# Altium project EMBL51537_SC_SP2_V2.1_20210906.PrjPcb
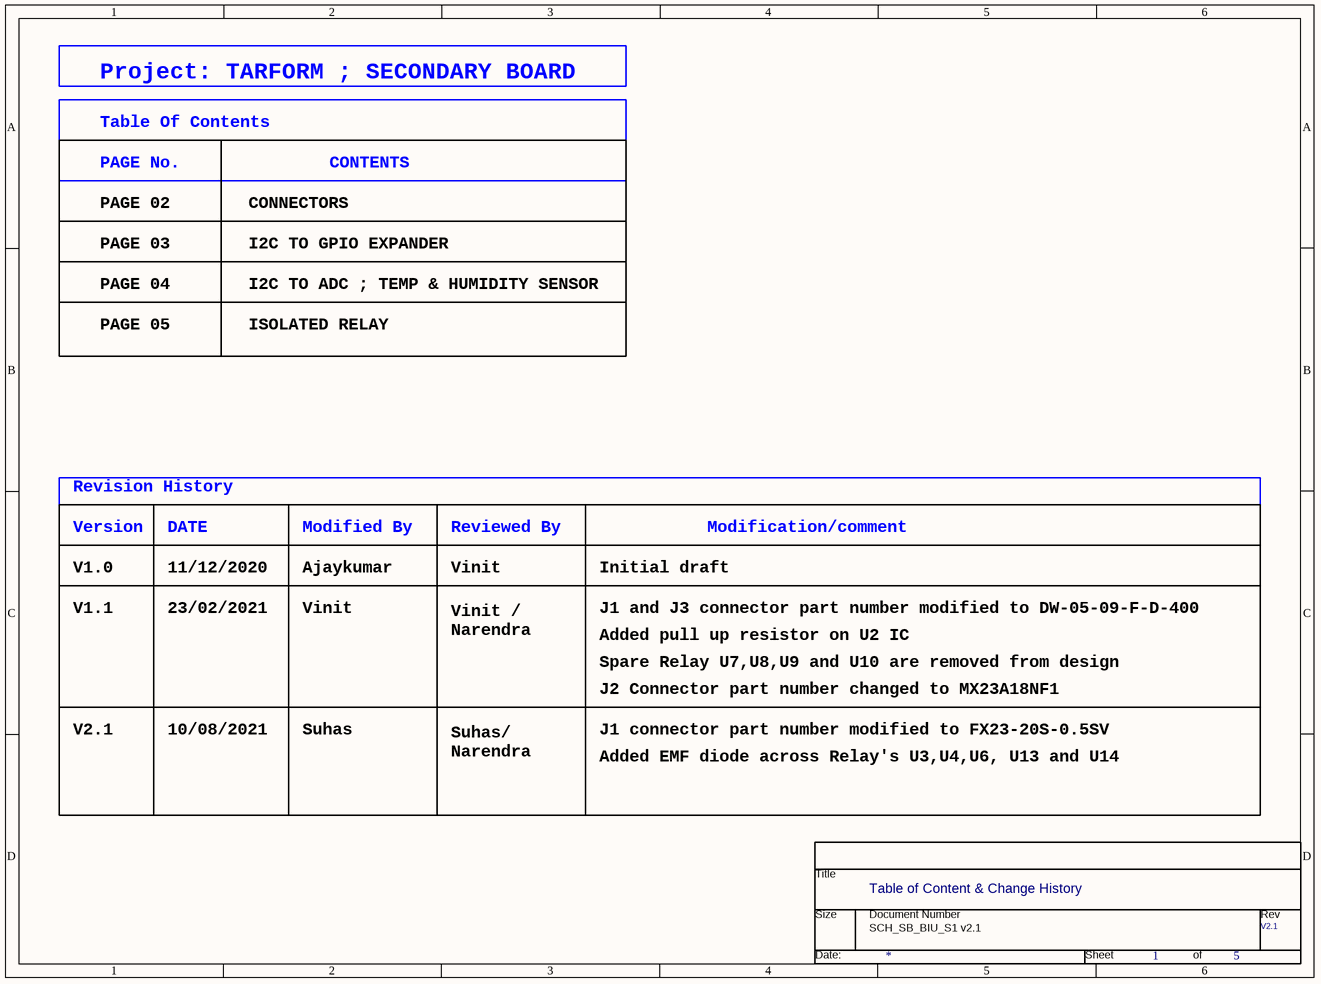
[diagram p0: PAGE01_CONTENT.SchDoc]
5 sheets, 128 parts. Net scope: global (net labels, ports and power ports of the same name join across sheets).
Sheets:
  PAGE01_CONTENT.SchDoc
  PAGE02_CONNECTOR.SchDoc
  PAGE03_I2C-GPIO.SchDoc
  PAGE04_TEMP & HUMIDITY.SchDoc
  PAGE05_ISO_RELAYS.SchDoc

## Sheet PAGE01_CONTENT.SchDoc
size 246 x 182 mm

### Parts
(Parts that share a designator on the sheet are numbered #1, #2 ... from top to bottom, then left to right.)
*#1  Page Count: 5  Page Number: 1  Title: Table of Content & Change History  RevCode: V2.1  (hidden comment: TitleBlock0)  (graphical)

### Notes on the sheet
- Project: TARFORM ; SECONDARY BOARD
- Table Of Contents
- PAGE No.
- CONTENTS
- PAGE 03
- PAGE 02
- I2C TO GPIO EXPANDER
- CONNECTORS
- PAGE 05
- PAGE 04
- I2C TO ADC ; TEMP & HUMIDITY SENSOR
- ISOLATED RELAY
- Version
- Revision History
- DATE
- Modified By
- Reviewed By
- Modification/comment
- V1.0
- 11/12/2020
- Ajaykumar
- Vinit
- Vinit /
  Narendra
- Initial draft
- V1.1
- 23/02/2021
- J1 and J3 connector part number modified to DW-05-09-F-D-400
- Added pull up resistor on U2 IC
- Spare Relay U7,U8,U9 and U10 are removed from design
- V2.1
- 10/08/2021
- Suhas
- Suhas/
  Narendra
- J2 Connector part number changed to MX23A18NF1
- J1 connector part number modified to FX23-20S-0.5SV
- Added EMF diode across Relay's U3,U4,U6, U13 and U14
- SCH_SB_BIU_S1 v2.1
- (in symbol TitleBlock0) Title; Size; Document Number; Rev; Date:; Sheet; of

### Library data of the parts
*#1 = TitleBlock0: Page Size: A; Page Create Date: March  8, 1995; Page Modify Date: *

## Sheet PAGE02_CONNECTOR.SchDoc
size 386 x 246 mm
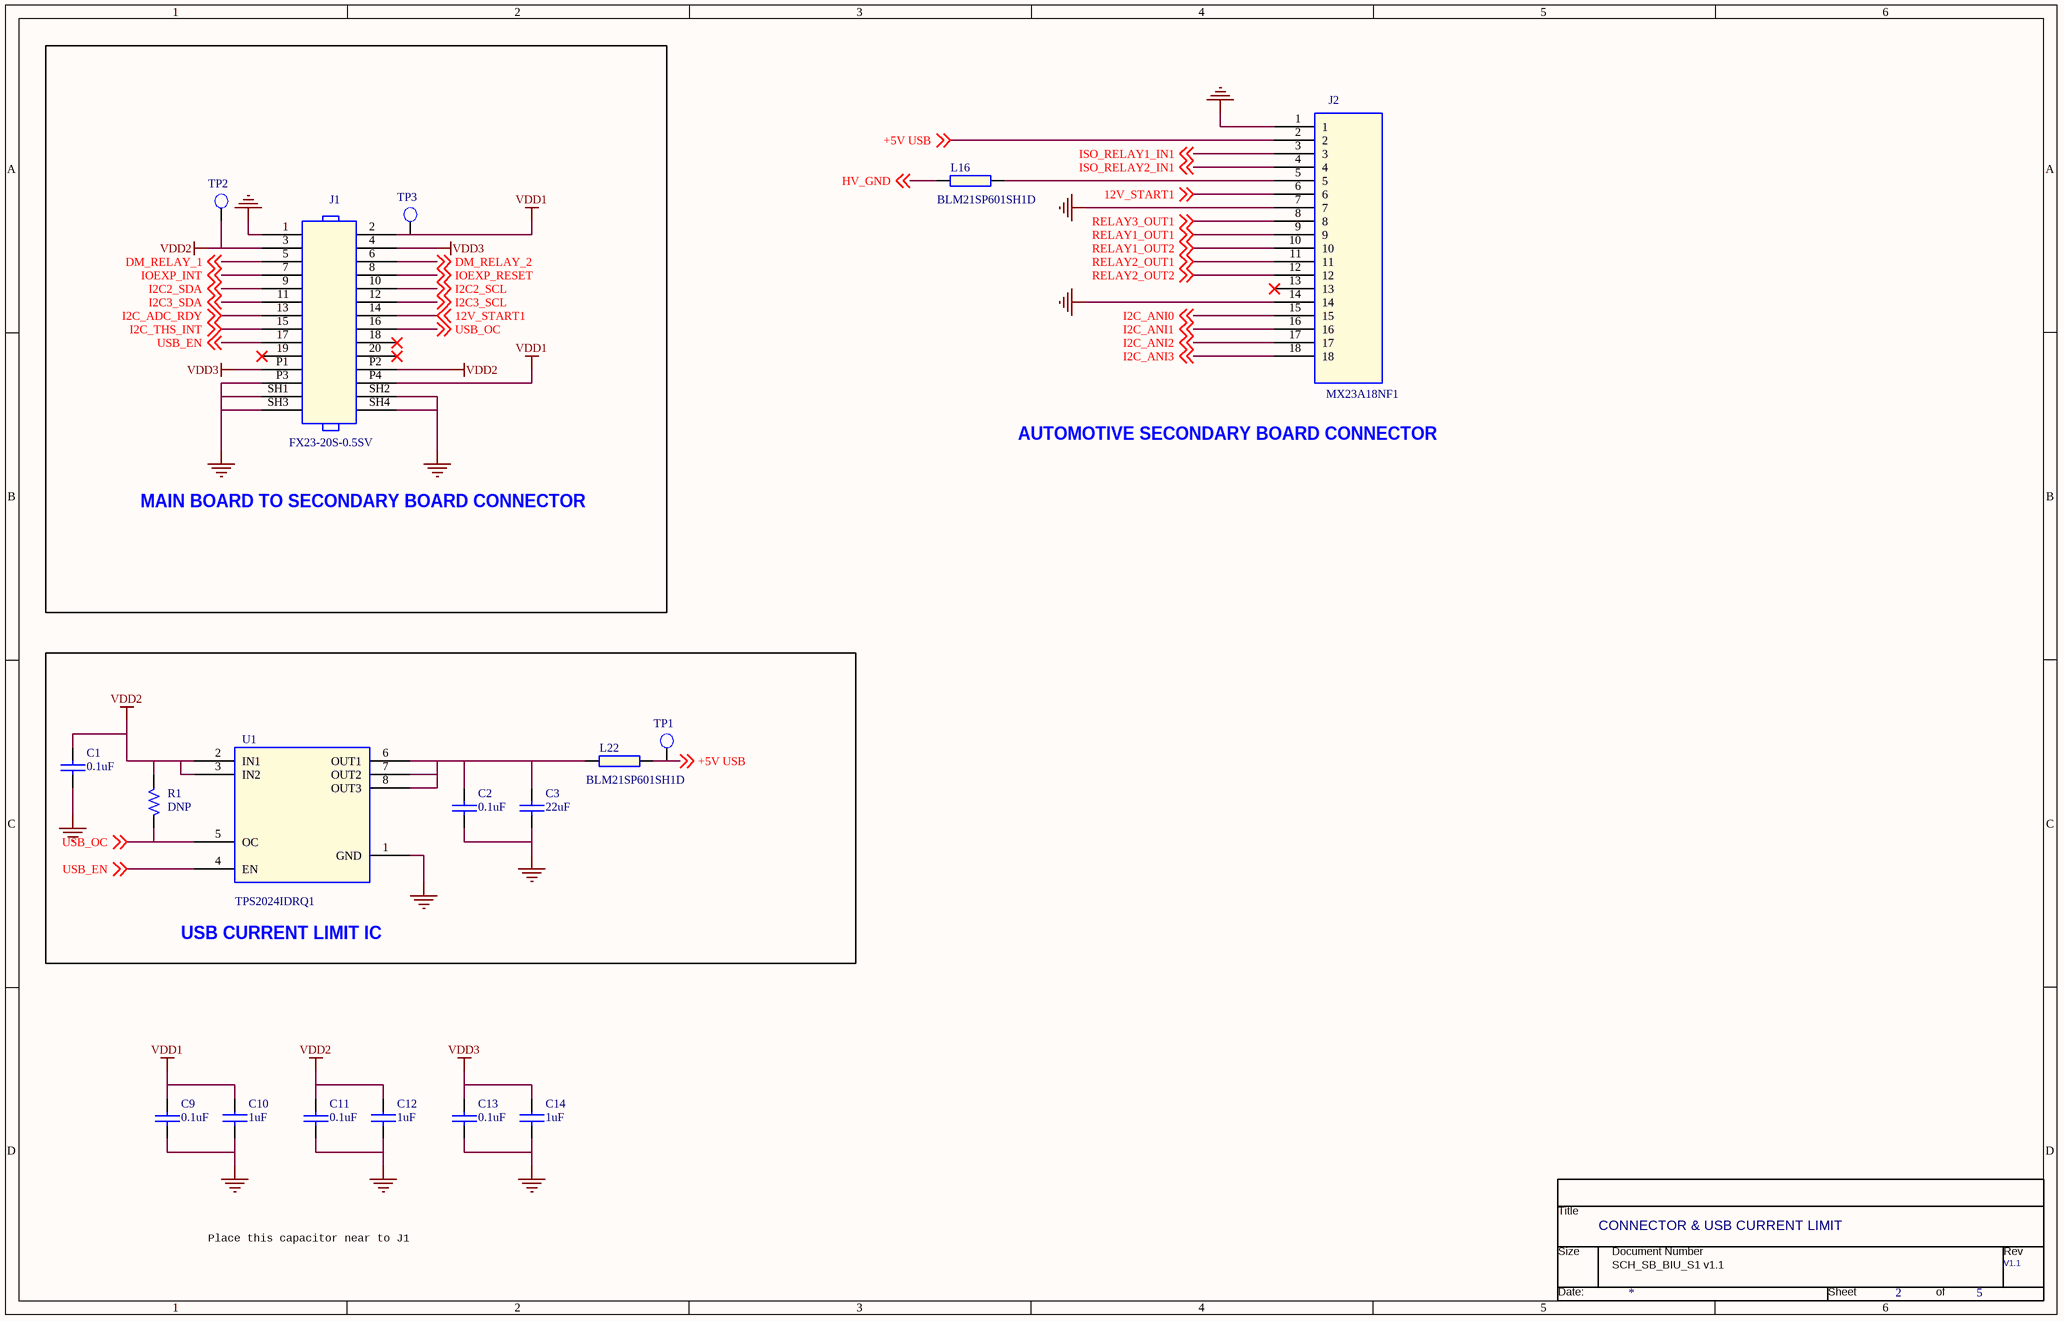
[diagram p1: PAGE02_CONNECTOR.SchDoc]

### Parts
(Parts that share a designator on the sheet are numbered #1, #2 ... from top to bottom, then left to right.)
*#2  Page Count: 5  Page Number: 2  Title: CONNECTOR & USB CURRENT LIMIT  RevCode: V1.1  (hidden comment: TitleBlock0)  (graphical)
C1  0.1uF  [CAPC1005X55N_A]
C2  0.1uF  [CAPC1005X55N_A]
C3  22uF  [CAPC1608X80N_A]
C9  0.1uF  [CAPC1005X55N_A]
C10  1uF  [CAPC1608X90N_A]
C11  0.1uF  [CAPC1005X55N_A]
C12  1uF  [CAPC1608X90N_A]
C13  0.1uF  [CAPC1005X55N_A]
C14  1uF  [CAPC1608X90N_A]
J1  FX23-20S-0.5SV  [HIROSE_FX23-20S-0P5SV]
J2  MX23A18NF1  [JAE_MX23A18NF1]
L16  BLM21SP601SH1D  [INDC1608X95N]
L22  BLM21SP601SH1D  [INDC1608X95N]
R1  DNP  [AX/RC05]
TP1  T POINT R  [TPC160H100]  (value not drawn)
TP2  T POINT R  [TPC160H100]  (value not drawn)
TP3  T POINT R  [TPC160H100]  (value not drawn)
U1  TPS2024IDRQ1  [SOIC127P600X175-8N_TI]

### Blocks framed on the sheet
MAIN BOARD TO SECONDARY BOARD CONNECTOR: J1 TP2 TP3
USB CURRENT LIMIT IC: C1-C3 L22 R1 TP1 U1

### Nets
GND: C1.2 C2.2 C3.2 C9.2 C10.2 C11.2 C12.2 C13.2 C14.2 J1.1 J1.P3 J1.SH1 J1.SH2 J1.SH3 J1.SH4 J2.1 J2.7 J2.14 U1.1(GND)
VDD1: C9.1 C10.1 J1.2 J1.P4 TP3.1(TP)
VDD2: C1.1 C11.1 C12.1 J1.3 J1.P2 R1.1 TP2.1(TP) U1.2(IN1) U1.3(IN2)
VDD3: C13.1 C14.1 J1.4 J1.P1
12V_START1: J1.14 J2.6 ; off-sheet 12V_START1
+5V USB: J2.2 L22.2 TP1.1(TP) ; off-sheet +5V USB
DM_RELAY_1: J1.5 ; off-sheet DM_RELAY_1
DM_RELAY_2: J1.6 ; off-sheet DM_RELAY_2
HV_GND: L16.1 ; off-sheet HV_GND
I2C2_SCL: J1.10 ; off-sheet I2C2_SCL
I2C2_SDA: J1.9 ; off-sheet I2C2_SDA
I2C3_SCL: J1.12 ; off-sheet I2C3_SCL
I2C3_SDA: J1.11 ; off-sheet I2C3_SDA
I2C_ADC_RDY: J1.13 ; off-sheet I2C_ADC_RDY
I2C_ANI0: J2.15 ; off-sheet I2C_ANI0
I2C_ANI1: J2.16 ; off-sheet I2C_ANI1
I2C_ANI2: J2.17 ; off-sheet I2C_ANI2
I2C_ANI3: J2.18 ; off-sheet I2C_ANI3
I2C_THS_INT: J1.15 ; off-sheet I2C_THS_INT
IOEXP_INT: J1.7 ; off-sheet IOEXP_INT
IOEXP_RESET: J1.8 ; off-sheet IOEXP_RESET
ISO_RELAY1_IN1: J2.3 ; off-sheet ISO_RELAY1_IN1
ISO_RELAY2_IN1: J2.4 ; off-sheet ISO_RELAY2_IN1
RELAY1_OUT1: J2.9 ; off-sheet RELAY1_OUT1
RELAY1_OUT2: J2.10 ; off-sheet RELAY1_OUT2
RELAY2_OUT1: J2.11 ; off-sheet RELAY2_OUT1
RELAY2_OUT2: J2.12 ; off-sheet RELAY2_OUT2
RELAY3_OUT1: J2.8 ; off-sheet RELAY3_OUT1
USB_EN: J1.17 U1.4(EN) ; off-sheet USB_EN
USB_OC: J1.16 R1.2 U1.5(OC) ; off-sheet USB_OC
NetC2_1: C2.1 C3.1 L22.1 U1.6(OUT1) U1.7(OUT2) U1.8(OUT3)
NetJ2_5: J2.5 L16.2

Not connected (* = marked no-connect by the designer): J1 18(9)* 19(22)* 20(10)*; J2 13*

### Notes on the sheet
- AUTOMOTIVE SECONDARY BOARD CONNECTOR
- Place this capacitor near to J1
- SCH_SB_BIU_S1 v1.1
- (in symbol TitleBlock0) Title; Size; Document Number; Rev; Date:; Sheet; of

### Library data of the parts
*#2 = TitleBlock0: Page Size: A; Page Create Date: March  8, 1995; Page Modify Date: *
C1 C2 C9 C11 C13 = CAP_NP_78: CAP CER 0.1uF 16V 10% X7R 0402; Manufacturer: MURATA; Manufacturere's P/N: GRM155R71C104KA88J; CLASS: DISCRETE; SIGNAL_MODEL: DEFAULT_CAPACITOR_100000pF_2_1; AGILE_PN: 150-75182; CAD_APPROVED: Yes; FPLIST: CC0402_25,CC0402_HD,0402_CC; WVDC: 16V; Tolerance: 10%; ROHS: Yes; HEIGHT: 0.635MM; TOL: 10%; PCB Footprint: CAPC1005X55N_A
  C1 C2: package: 0402
  C9 C11 C13: Package: 0402
C3 = CAP_NP_78: MLCC - SMD/SMT 22uF+/-20% 16V X5R; Manufacturer: SAMSUNG ELECTRO; Manufacturere's P/N: CL10A226MO7JZNC; CLASS: DISCRETE; SIGNAL_MODEL: DEFAULT_CAPACITOR_100000pF_2_1; AGILE_PN: 150-75182; CAD_APPROVED: Yes; FPLIST: CC0402_25,CC0402_HD,0402_CC; package: 0603; WVDC: 16V; ROHS: Yes; PCB Footprint: CAPC1608X80N_A
C10 C12 C14 = CAP NP: CAP CER 1uF 25V 10% X7R 0603; Manufacturer: TDK; Manufacturere's P/N: CGA3E1X7R1E105K080AC; Package: 0603; PCB Footprint: CAPC1608X90N_A
J1 = CONN PCB 12x2-P_1: Manufacturere's P/N: FX23-20S-0.5SV; Manufacturer Part Number: FX23-20S-0.5SV; PCB Footprint: HIROSE_FX23-20S-0P5SV
J2 = MX23A18NF1_0: CONN HEADER R/A 18POS 2.5MM; Manufacturer: JAE Electronics; PCB Footprint: JAE_MX23A18NF1; Manufacturer Part Number: MX23A18NF1; Manufacturere's P/N: MX23A18NF1
L16 L22 = L-33R100MHz-3A-25%-0603: FERRITEBEAD SMD Z100MHZ=600OHM 2; Manufacturer: Murata Electronics; Tolerance: 25%; Rating: 3A; PCB Footprint: INDC2012X105N; User_Value: BLM21SP601SH1D; Manufacturere's P/N: BLM21SP601SH1D; Manufacturer Part Number: BLM21SP601SH1D; Package: 0805
R1 = R_0: RES SMD 10K OHM 1% 1/10W 0603; Manufacturer Part Number: RCA060310K0FKEA; Manufacturer: Vishay Dale; TC2: 0; POWER: RMAX; MAX_TEMP: RTMAX; SLOPE: RSMAX; VOLTAGE: RVMAX; PSpiceTemplate: R^@REFDES %1 %2 ?TOLERANCE|R^@REFDES| @VALUE TC=@TC1,@TC2 ?TOLERANCE|\n.model R^@REFDES RES R=1 DEV=@TOLERANCE%|; DIST: FLAT; PCB Footprint: RESC1608X55N_B; TC1: 0; TOLERANCE: 1%; Manufacturere's P/N: RCA060310K0FKEA; Package: 0603; Value: DNP
U1 = TPS2024IDRQ1_0: Power Switch ICs - Power Distribution Auto Cat Pwr-Dist Sw; Manufacturer: TI; Package: SOIC-8; Manufacturere's P/N: TPS2024IDRQ1; PCB Footprint: SOIC127P600X175-8N_TI
TP1-TP3 = T POINT R: PCB Footprint: TPC160H100

## Sheet PAGE03_I2C-GPIO.SchDoc
size 386 x 246 mm
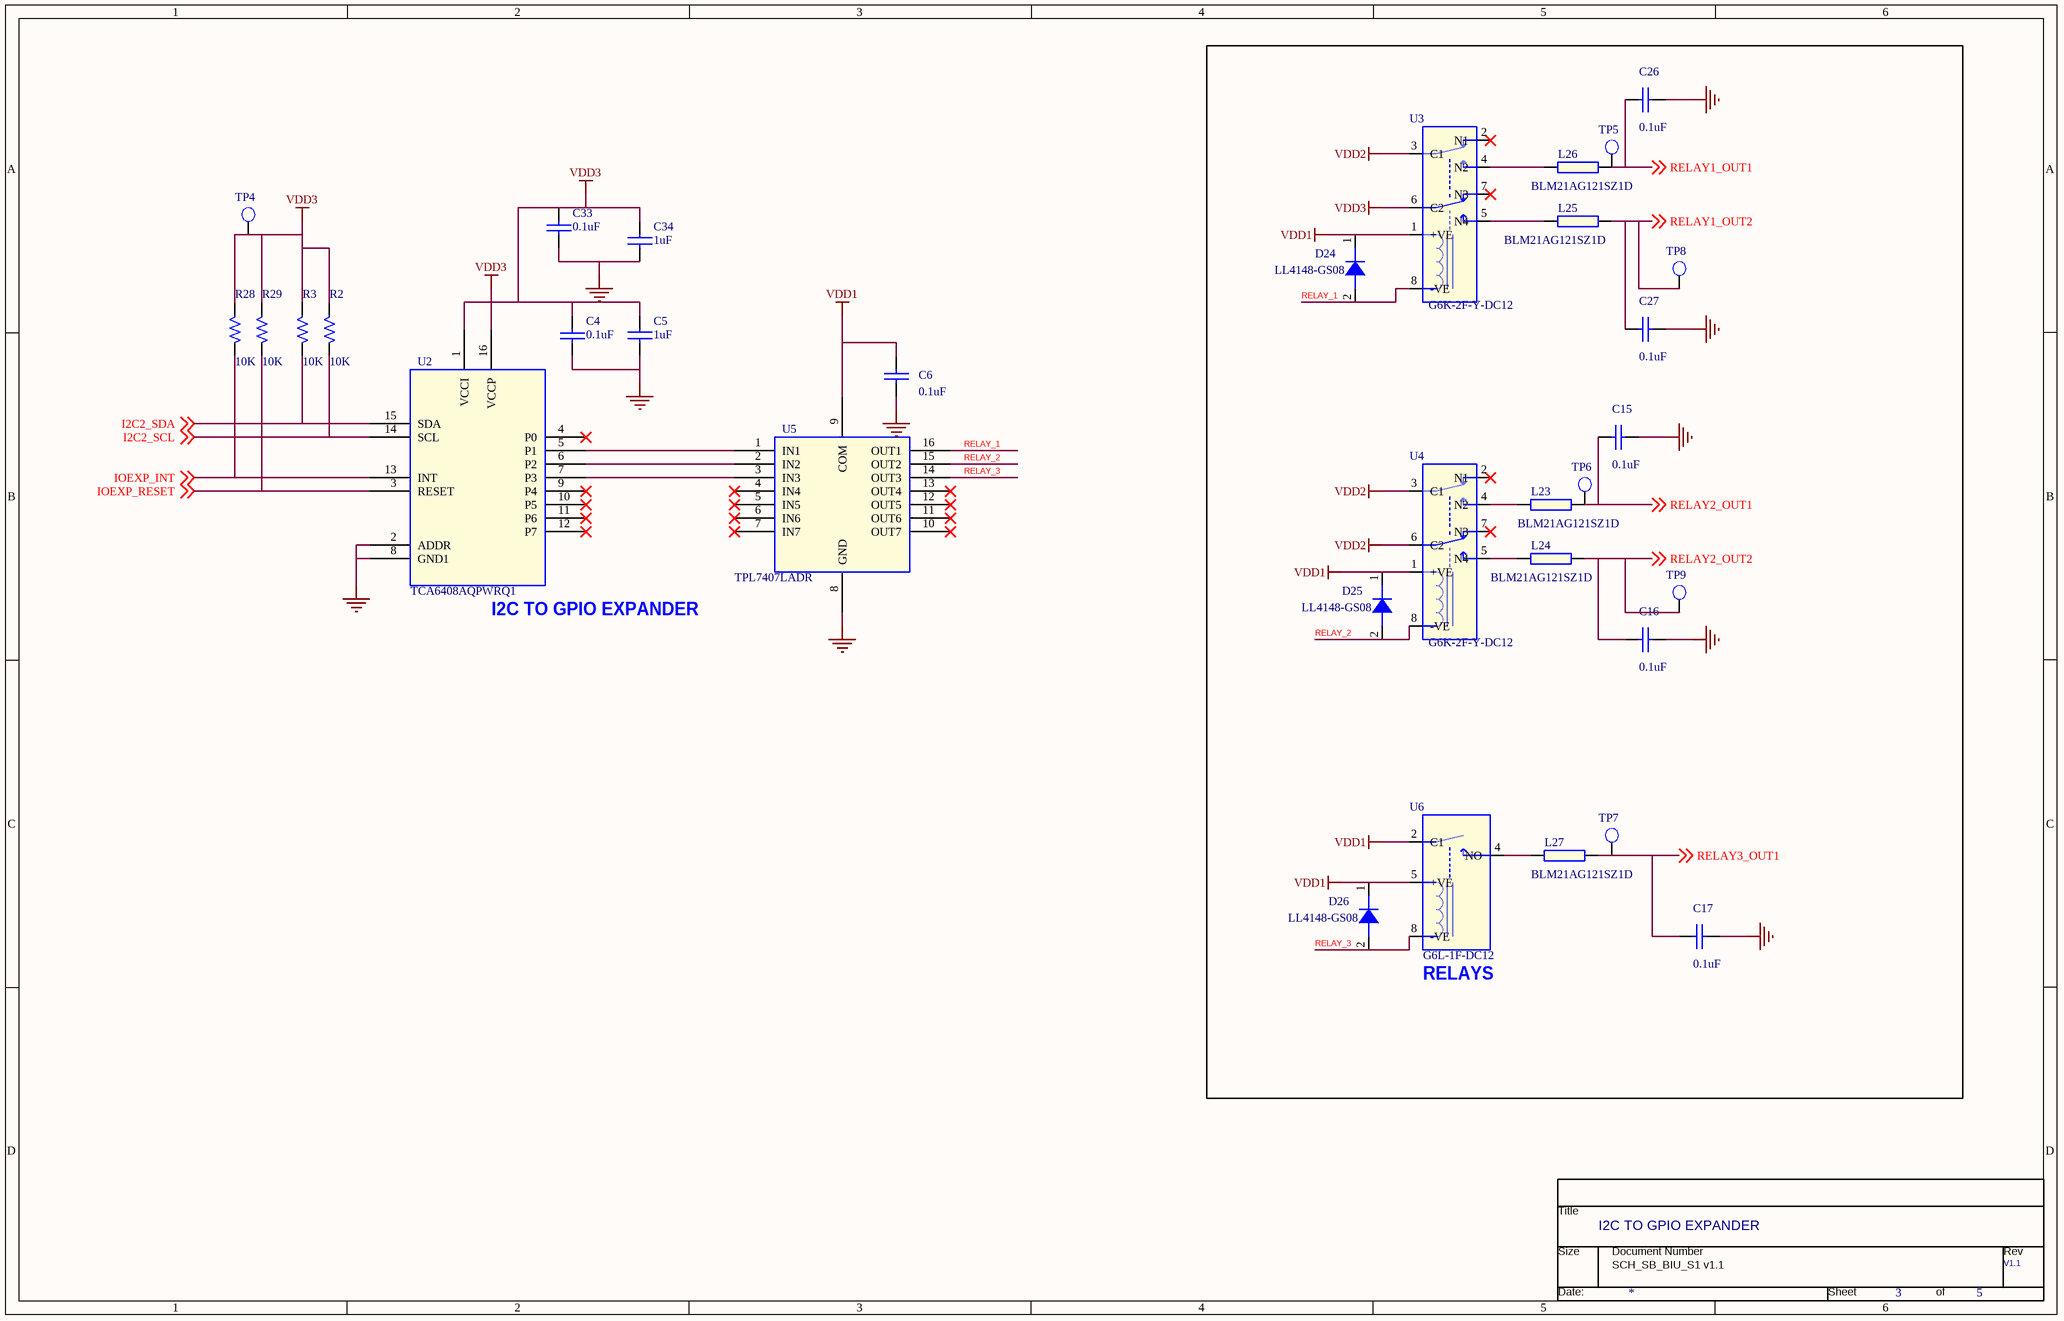
[diagram p2: PAGE03_I2C-GPIO.SchDoc]

### Parts
(Parts that share a designator on the sheet are numbered #1, #2 ... from top to bottom, then left to right.)
*#3  Page Count: 5  Page Number: 3  Title: I2C TO GPIO EXPANDER  RevCode: V1.1  (hidden comment: TitleBlock0)  (graphical)
C4  0.1uF  [CAPC1005X55N_A]
C5  1uF  [CAPC1608X90N_A]
C6  0.1uF  [CAPC1608X90N]
C15  0.1uF  [CAPC1608X90N]
C16  0.1uF  [CAPC1608X90N]
C17  0.1uF  [CAPC1608X90N]
C26  0.1uF  [CAPC1608X90N]
C27  0.1uF  [CAPC1608X90N]
C33  0.1uF  [CAPC1005X55N_A]
C34  1uF  [CAPC1608X90N_A]
D24  LL4148-GS08  [DIOMELF3515N]
D25  LL4148-GS08  [DIOMELF3515N]
D26  LL4148-GS08  [DIOMELF3515N]
L23  BLM21AG121SZ1D  [INDC1608X95N]
L24  BLM21AG121SZ1D  [INDC1608X95N]
L25  BLM21AG121SZ1D  [INDC1608X95N]
L26  BLM21AG121SZ1D  [INDC1608X95N]
L27  BLM21AG121SZ1D  [INDC1608X95N]
R2  10K  [AX/RC05]
R3  10K  [AX/RC05]
R28  10K  [AX/RC05]
R29  10K  [AX/RC05]
TP4  T POINT R  [TPC160H100]  (value not drawn)
TP5  T POINT R  [TPC160H100]  (value not drawn)
TP6  T POINT R  [TPC160H100]  (value not drawn)
TP7  T POINT R  [TPC160H100]  (value not drawn)
TP8  T POINT R  [TPC160H100]  (value not drawn)
TP9  T POINT R  [TPC160H100]  (value not drawn)
U2  TCA6408AQPWRQ1  [TSSOP65P640X120-16N_B]
U3  G6K-2F-Y-DC12  [RELAY_G6K-2F-Y-DC12]
U4  G6K-2F-Y-DC12  [RELAY_G6K-2F-Y-DC12]
U5  TPL7407LADR  [SOIC127P600X175-16N_TI]
U6  G6L-1F-DC12  [RELAY_G6L-1F-DC12]

### Blocks framed on the sheet
RELAYS: C15-C17 C26 C27 D24-D26 L23-L27 TP5-TP9 U3 U4 U6

### Nets
GND: C4.2 C5.2 C6.1 C15.1 C16.1 C17.1 C26.1 C27.1 C33.2 C34.2 U2.2(ADDR) U2.8(GND1) U5.8(GND)
VDD1: C6.2 D24.1(K) D25.1(K) D26.1(K) U3.1(+VE) U4.1(+VE) U5.9(COM) U6.2(C1) U6.5(+VE)
VDD2: U3.3(C1) U4.3(C1) U4.6(C2)
VDD3: C4.1 C5.1 C33.1 C34.1 R2.1 R3.1 R28.1 R29.1 TP4.1(TP) U2.1(VCCI) U2.16(VCCP) U3.6(C2)
I2C2_SCL: R2.2 U2.14(SCL) ; off-sheet I2C2_SCL
I2C2_SDA: R3.2 U2.15(SDA) ; off-sheet I2C2_SDA
IOEXP_INT: R28.2 U2.13(INT) ; off-sheet IOEXP_INT
IOEXP_RESET: R29.2 U2.3(RESET) ; off-sheet IOEXP_RESET
RELAY1_OUT1: C26.2 L26.2 TP5.1(TP) ; off-sheet RELAY1_OUT1
RELAY1_OUT2: C27.2 L25.2 TP8.1(TP) ; off-sheet RELAY1_OUT2
RELAY2_OUT1: C15.2 L23.2 TP6.1(TP) ; off-sheet RELAY2_OUT1
RELAY2_OUT2: C16.2 L24.2 TP9.1(TP) ; off-sheet RELAY2_OUT2
RELAY3_OUT1: C17.2 L27.2 TP7.1(TP) ; off-sheet RELAY3_OUT1
RELAY_1: D24.2(A) U3.8(-VE) U5.16(OUT1)
RELAY_2: D25.2(A) U4.8(-VE) U5.15(OUT2)
RELAY_3: D26.2(A) U5.14(OUT3) U6.8(-VE)
NetL23_1: L23.1 U4.4(N2)
NetL24_1: L24.1 U4.5(N4)
NetL25_1: L25.1 U3.5(N4)
NetL26_1: L26.1 U3.4(N2)
NetL27_1: L27.1 U6.4(NO)
NetU2_5: U2.5(P1) U5.1(IN1)
NetU2_6: U2.6(P2) U5.2(IN2)
NetU2_7: U2.7(P3) U5.3(IN3)

Not connected (* = marked no-connect by the designer): U2 4(P0)* 9(P4)* 10(P5)* 11(P6)* 12(P7)*; U3 2(N1)* 7(N3)*; U4 2(N1)* 7(N3)*; U5 4(IN4)* 5(IN5)* 6(IN6)* 7(IN7)* 10(OUT7)* 11(OUT6)* 12(OUT5)* 13(OUT4)*

### Notes on the sheet
- (near U2) I2C TO GPIO EXPANDER
- SCH_SB_BIU_S1 v1.1
- (in symbol TitleBlock0) Title; Size; Document Number; Rev; Date:; Sheet; of

### Library data of the parts
*#3 = TitleBlock0: Page Size: A; Page Create Date: March  8, 1995; Page Modify Date: *
C4 C33 = CAP_NP_78: CAP CER 0.1uF 16V 10% X7R 0402; Manufacturere's P/N: GRM155R71C104KA88J; Manufacturer: MURATA; CLASS: DISCRETE; FPLIST: CC0402_25,CC0402_HD,0402_CC; CAD_APPROVED: Yes; AGILE_PN: 150-75182; SIGNAL_MODEL: DEFAULT_CAPACITOR_100000pF_2_1; PCB Footprint: CAPC1005X55N_A; TOL: 10%; HEIGHT: 0.635MM; ROHS: Yes; Tolerance: 10%; WVDC: 16V; Package: 0402
C5 C34 = CAP NP: CAP CER 1uF 25V 10% X7R 0603; Manufacturere's P/N: CGA3E1X7R1E105K080AC; Manufacturer: TDK; PCB Footprint: CAPC1608X90N_A; Package: 0603
C6 C15-C17 = CAP_NP_78: CAP CER 0.1UF 50V X7R 0603; Manufacturere's P/N: GRM188R71H104KA93D; Manufacturer: MURATA; CLASS: DISCRETE; CAD_APPROVED: Yes; Tolerance: ±10%; AGILE_PN: 150-75182; SIGNAL_MODEL: DEFAULT_CAPACITOR_100000pF_2_1; PCB Footprint: CAPC1608X90N; WVDC: 50V; HEIGHT: 0.635MM; ROHS: Yes; Package: 0603
C26 C27 = CAP_NP_78: CAP CER 0.1UF 50V X7R 0603; Manufacturer: MURATA; Manufacturere's P/N: GRM188R71H104KA93D; CLASS: DISCRETE; SIGNAL_MODEL: DEFAULT_CAPACITOR_100000pF_2_1; AGILE_PN: 150-75182; Tolerance: ±10%; CAD_APPROVED: Yes; PCB Footprint: CAPC1608X90N; Package: 0603; ROHS: Yes; HEIGHT: 0.635MM; WVDC: 50V
D24-D26 = DIODE PIN_1: DIODE GEN PURP 75V 300MA SOD80; Manufacturer: Vishay Semiconductor; PCB Footprint: DIOMELF3515N; Manufacturer Part Number: LL4148-GS08; Package: SOD-80; Manufacturere's P/N: LL4148-GS08
L23-L27 = L-33R100MHz-3A-25%-0603: Ferrite Beads 0805 120ohms 1000mA Auto Infotainment; Manufacturer: Murata Electronics; Tolerance: 25%; Rating: 3A; PCB Footprint: INDC2012X105N; User_Value: BLM21AG121SZ1D; Package: 0805; Manufacturer Part Number: BLM21AG121SZ1D; Manufacturere's P/N: BLM21AG121SZ1D
R2 R29 = R_0: RES SMD 10K OHM 1% 1/10W 0603; Manufacturere's P/N: RCA060310K0FKEA; Manufacturer: Vishay Dale; TC2: 0; POWER: RMAX; MAX_TEMP: RTMAX; SLOPE: RSMAX; VOLTAGE: RVMAX; PSpiceTemplate: R^@REFDES %1 %2 ?TOLERANCE|R^@REFDES| @VALUE TC=@TC1,@TC2 ?TOLERANCE|\n.model R^@REFDES RES R=1 DEV=@TOLERANCE%|; DIST: FLAT; PCB Footprint: RESC1608X55N_B; TC1: 0; TOLERANCE: 1%; Package: 0603; Manufacturer Part Number: RCA060310K0FKEA; Value: 10K
R3 R28 = R_0: RES SMD 10K OHM 1% 1/10W 0603; Manufacturer: Vishay Dale; Manufacturere's P/N: RCA060310K0FKEA; TC2: 0; POWER: RMAX; MAX_TEMP: RTMAX; SLOPE: RSMAX; VOLTAGE: RVMAX; PSpiceTemplate: R^@REFDES %1 %2 ?TOLERANCE|R^@REFDES| @VALUE TC=@TC1,@TC2 ?TOLERANCE|\n.model R^@REFDES RES R=1 DEV=@TOLERANCE%|; DIST: FLAT; PCB Footprint: RESC1608X55N_B; TC1: 0; TOLERANCE: 1%; Package: 0603; Manufacturer Part Number: RCA060310K0FKEA; Value: 10K
U2 = TCA6408AQPWRQ1_1: Interface - I/O Expanders Automotive Low-Voltage 8-Bit I2C; Manufacturer: TI; PCB Footprint: TSSOP65P640X120-16N_B; Manufacturere's P/N: TCA6408AQPWRQ1; Package: TSSOP-16
U3 = Relay_DPDT_nb_0: Low Signal Relays - PCB Gullwing NoLatch 3.2 DPDT 12VDC 100mW; Manufacturer: Omron Electronics; PSpiceTemplate: X^@REFDES %A %B %NO1 %NC1 %COM1 %NO2 %NC2 %COM2 @MODEL PARAMS:\n+ T_make=@T_MAKE\n+ T_break=@T_BREAK\n+ I_pull=@I_PULL\n+ I_drop=@I_DROP\n+ R_coil=@R_COIL\n+ L_coil=@L_COIL\n+ R_open=@R_OPEN\n+ R_close=@R_CLOSE\n+Contact_match=@CONTACT_MATCH; CONTACT_MATCH: 0.95; R_CLOSE: .05; R_OPEN: 100MEG; L_COIL: 5mH; R_COIL: 100; I_DROP: 25ma; I_PULL: 35ma; T_BREAK: 10m; T_MAKE: 20m; PCB Footprint: RELAY_G6K-2F-Y-DC12; Manufacturere's P/N: G6K-2F-Y-DC12
U4 = Relay_DPDT_nb_0: Low Signal Relays - PCB Gullwing NoLatch 3.2 DPDT 12VDC 100mW; Manufacturer: Omron Electronics; PSpiceTemplate: X^@REFDES %A %B %NO1 %NC1 %COM1 %NO2 %NC2 %COM2 @MODEL PARAMS:\n+ T_make=@T_MAKE\n+ T_break=@T_BREAK\n+ I_pull=@I_PULL\n+ I_drop=@I_DROP\n+ R_coil=@R_COIL\n+ L_coil=@L_COIL\n+ R_open=@R_OPEN\n+ R_close=@R_CLOSE\n+Contact_match=@CONTACT_MATCH; CONTACT_MATCH: 0.95; R_CLOSE: .05; R_OPEN: 100MEG; L_COIL: 5mH; R_COIL: 100; I_DROP: 25ma; I_PULL: 35ma; T_BREAK: 10mSec; T_MAKE: 20mSec; PCB Footprint: RELAY_G6K-2F-Y-DC12; Manufacturere's P/N: G6K-2F-Y-DC12
U5 = TPL7407LADR_0: Gate Drivers 30-V, 7-Channel NMOS Array Low-Side Driver; Manufacturer: TI; PCB Footprint: SOIC127P600X175-16N_TI; Manufacturere's P/N: TPL7407LADR; Package: SOP-16
U6 = Relay_SPDT_b_0: Low Signal Relays - PCB LO PROF SPST 12VDC; Manufacturer: Omron Electronics; T_BOUNCE: 5mSec; T_MAKE: 20mSec; T_BREAK: 10mSec; I_PULL: 35ma; I_DROP: 25ma; R_COIL: 100; L_COIL: 5mH; R_OPEN: 100MEG; R_CLOSE: .05; PSpiceTemplate: X^@REFDES %A %B %NO %NC %COM @MODEL PARAMS:\n+ T_make=@T_MAKE\n+ T_break=@T_BREAK\n+ T_bounce=@T_BOUNCE\n+ I_pull=@I_PULL\n+ I_drop=@I_DROP\n+ R_coil=@R_COIL\n+ L_coil=@L_COIL\n+ R_open=@R_OPEN\n+ R_close=@R_CLOSE; PCB Footprint: RELAY_G6L-1F-DC12; Manufacturere's P/N: G6L-1F-DC12
TP4-TP9 = T POINT R: PCB Footprint: TPC160H100

## Sheet PAGE04_TEMP & HUMIDITY.SchDoc
size 386 x 246 mm
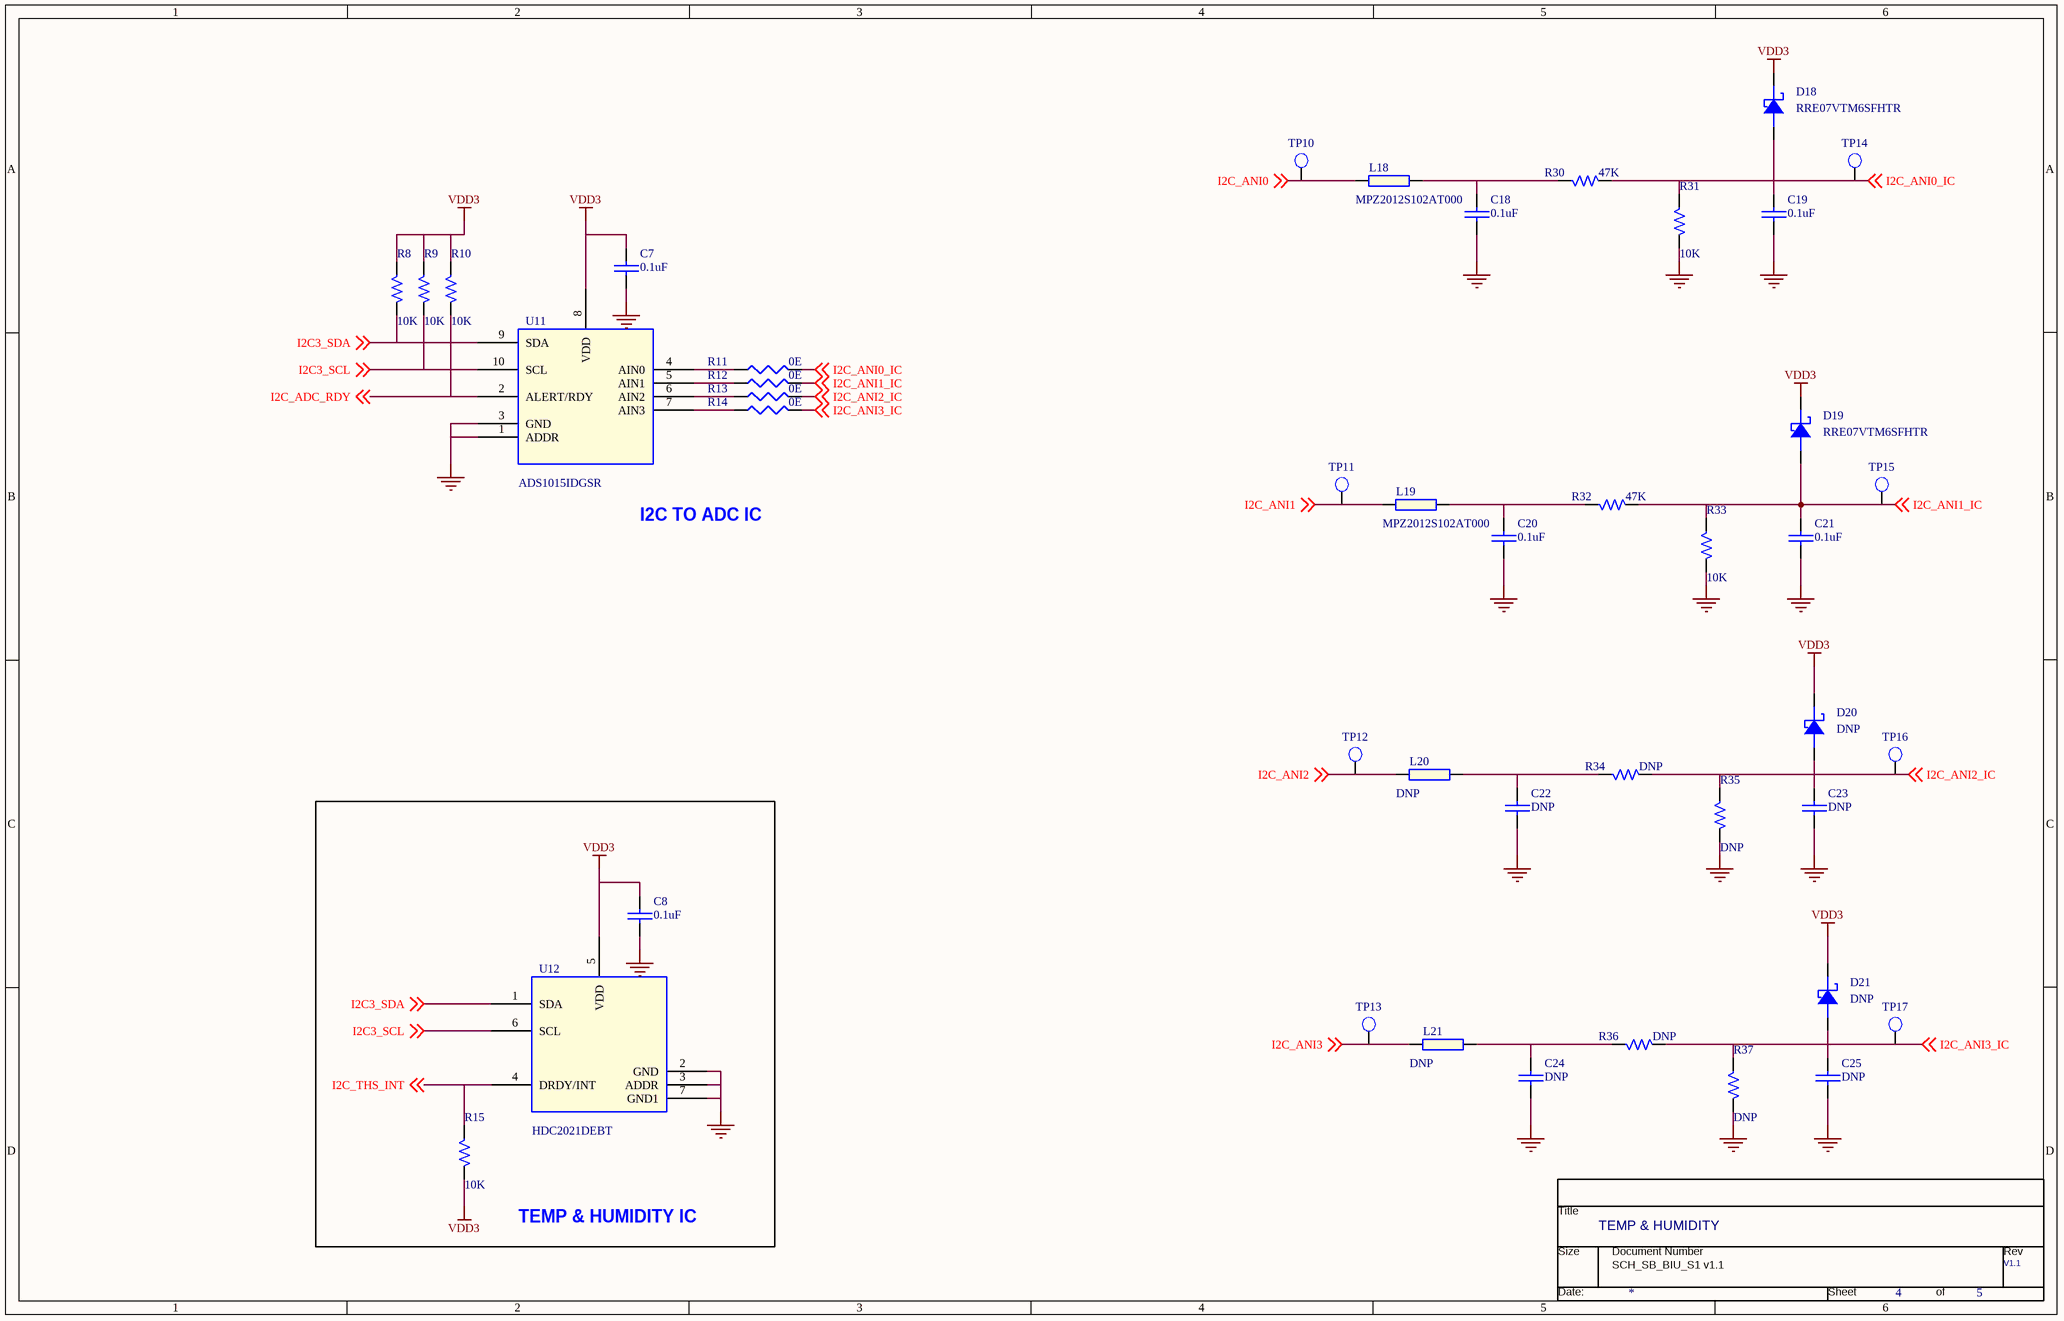
[diagram p3: PAGE04_TEMP & HUMIDITY.SchDoc]

### Parts
(Parts that share a designator on the sheet are numbered #1, #2 ... from top to bottom, then left to right.)
*#4  Page Count: 5  Page Number: 4  Title: TEMP & HUMIDITY  RevCode: V1.1  (hidden comment: TitleBlock0)  (graphical)
C7  0.1uF  [CAPC1005X55N_A]
C8  0.1uF  [CAPC1005X55N_A]
C18  0.1uF  [CAPC1005X55N_A]
C19  0.1uF  [CAPC1005X55N_A]
C20  0.1uF  [CAPC1005X55N_A]
C21  0.1uF  [CAPC1005X55N_A]
C22  DNP  [CAPC1005X55N_A]
C23  DNP  [CAPC1005X55N_A]
C24  DNP  [CAPC1005X55N_A]
C25  DNP  [CAPC1005X55N_A]
D18  RRE07VTM6SFHTR  [SODFL2514X80N_2K]
D19  RRE07VTM6SFHTR  [SODFL2514X80N_2K]
D20  DNP  [SODFL2514X80N_2K]
D21  DNP  [SODFL2514X80N_2K]
L18  MPZ2012S102AT000  [INDC1608X95N]
L19  MPZ2012S102AT000  [INDC1608X95N]
L20  User_Value: DNP  [INDC1608X95N]  (hidden comment: MPZ2012S102AT000)
L21  User_Value: DNP  [INDC1608X95N]  (hidden comment: MPZ2012S102AT000)
R8  10K  [AX/RC05]
R9  10K  [AX/RC05]
R10  10K  [AX/RC05]
R11  0E  [RESC1005X40N_A]
R12  0E  [RESC1005X40N_A]
R13  0E  [RESC1005X40N_A]
R14  0E  [RESC1005X40N_A]
R15  10K  [AX/RC05]
R30  47K  [AX/RC05]
R31  10K  [AX/RC05]
R32  47K  [AX/RC05]
R33  10K  [AX/RC05]
R34  DNP  [AX/RC05]
R35  DNP  [AX/RC05]
R36  DNP  [AX/RC05]
R37  DNP  [AX/RC05]
TP10  T POINT R  [TPC160H100]  (value not drawn)
TP11  T POINT R  [TPC160H100]  (value not drawn)
TP12  T POINT R  [TPC160H100]  (value not drawn)
TP13  T POINT R  [TPC160H100]  (value not drawn)
TP14  T POINT R  [TPC160H100]  (value not drawn)
TP15  T POINT R  [TPC160H100]  (value not drawn)
TP16  T POINT R  [TPC160H100]  (value not drawn)
TP17  T POINT R  [TPC160H100]  (value not drawn)
U11  ADS1015IDGSR  [VSSOP50P490X110-10N]
U12  HDC2021DEBT  [WSON100P300X300X92-7N]

### Blocks framed on the sheet
TEMP & HUMIDITY IC: C8 R15 U12

### Nets
GND: C7.2 C8.2 C18.2 C19.2 C20.2 C21.2 C22.2 C23.2 C24.2 C25.2 R31.2 R33.2 R35.2 R37.2 U11.1(ADDR) U11.3(GND) U12.2(GND) U12.3(ADDR) U12.7(GND1)
VDD3: C7.1 C8.1 D18.2(CATHODE) D19.2(CATHODE) D20.2(CATHODE) D21.2(CATHODE) R8.1 R9.1 R10.1 R15.2 U11.8(VDD) U12.5(VDD)
I2C3_SCL: R9.2 U11.10(SCL) U12.6(SCL) ; off-sheet I2C3_SCL
I2C3_SDA: R8.2 U11.9(SDA) U12.1(SDA) ; off-sheet I2C3_SDA
I2C_ADC_RDY: R10.2 U11.2(ALERT/RDY) ; off-sheet I2C_ADC_RDY
I2C_ANI0: L18.1 TP10.1(TP) ; off-sheet I2C_ANI0
I2C_ANI0_IC: C19.1 D18.1(ANODE) R11.2 R30.2 R31.1 TP14.1(TP) ; off-sheet I2C_ANI0_IC
I2C_ANI1: L19.1 TP11.1(TP) ; off-sheet I2C_ANI1
I2C_ANI1_IC: C21.1 D19.1(ANODE) R12.2 R32.2 R33.1 TP15.1(TP) ; off-sheet I2C_ANI1_IC
I2C_ANI2: L20.1 TP12.1(TP) ; off-sheet I2C_ANI2
I2C_ANI2_IC: C23.1 D20.1(ANODE) R13.2 R34.2 R35.1 TP16.1(TP) ; off-sheet I2C_ANI2_IC
I2C_ANI3: L21.1 TP13.1(TP) ; off-sheet I2C_ANI3
I2C_ANI3_IC: C25.1 D21.1(ANODE) R14.2 R36.2 R37.1 TP17.1(TP) ; off-sheet I2C_ANI3_IC
I2C_THS_INT: R15.1 U12.4(DRDY/INT) ; off-sheet I2C_THS_INT
NetC18_1: C18.1 L18.2 R30.1
NetC20_1: C20.1 L19.2 R32.1
NetC22_1: C22.1 L20.2 R34.1
NetC24_1: C24.1 L21.2 R36.1
NetR11_1: R11.1 U11.4(AIN0)
NetR12_1: R12.1 U11.5(AIN1)
NetR13_1: R13.1 U11.6(AIN2)
NetR14_1: R14.1 U11.7(AIN3)

### Notes on the sheet
- I2C TO ADC IC
- SCH_SB_BIU_S1 v1.1
- (in symbol TitleBlock0) Title; Size; Document Number; Rev; Date:; Sheet; of

### Library data of the parts
*#4 = TitleBlock0: Page Size: A; Page Create Date: March  8, 1995; Page Modify Date: *
C7 C8 C18-C21 = CAP_NP_78: as C1 on sheet PAGE02_CONNECTOR; WVDC: 16V; Tolerance: 10%; ROHS: Yes; HEIGHT: 0.635MM; TOL: 10%; Package: 0402; PCB Footprint: CAPC1005X55N_A
C22-C25 = CAP_NP_78: as C4 on sheet PAGE03_I2C-GPIO; Package: 0402; TOL: 10%; HEIGHT: 0.635MM; ROHS: Yes; Tolerance: 10%; WVDC: 16V; PCB Footprint: CAPC1005X55N_A
D18 D19 = DIODE SCHOTTKY: RECTIFIER DIODES (CORRESPONDS TO; Manufacturer: Rohm Semiconductor; Manufacturere's P/N: RRE07VTM6SFHTR; Manufacturer Part Number: RRE07VTM6SFHTR; Package: 2-SMD, Flat Lead; PCB Footprint: SODFL2514X80N_2K
D20 D21 = DIODE SCHOTTKY: RECTIFIER DIODES (CORRESPONDS TO; Manufacturere's P/N: RRE07VTM6SFHTR; Manufacturer: Rohm Semiconductor; Manufacturer Part Number: RRE07VTM6SFHTR; Package: 2-SMD, Flat Lead; PCB Footprint: SODFL2514X80N_2K
L18-L21 = L-33R100MHz-3A-25%-0603: FERRITE BEAD 1 KOHM 0805 1LN; Manufacturer: TDK Corporation; Tolerance: 25%; Rating: 3A; PCB Footprint: FB_MPZ2012S300ATD25; Package: 0805; Manufacturer Part Number: MPZ2012S102AT000; Manufacturere's P/N: MPZ2012S102AT000
  L18 L19: User_Value: MPZ2012S102AT000
R8 R31 R33 = R_0: RES SMD 10K OHM 1% 1/10W 0603; TC2: 0; POWER: RMAX; MAX_TEMP: RTMAX; SLOPE: RSMAX; VOLTAGE: RVMAX; PSpiceTemplate: R^@REFDES %1 %2 ?TOLERANCE|R^@REFDES| @VALUE TC=@TC1,@TC2 ?TOLERANCE|\n.model R^@REFDES RES R=1 DEV=@TOLERANCE%|; DIST: FLAT; MFG_PN01: RCA060310K0FKEA; MFG_NAME01: Vishay Dale; PCB Footprint: RESC1608X55N_B; TC1: 0; TOLERANCE: 1%; Manufacturer: Vishay Dale; Manufacturere's P/N: RCA060310K0FKEA; Package: 0603; Manufacturer Part Number: RCA060310K0FKEA; Value: 10K
R9 R10 = R_0: as R2 on sheet PAGE03_I2C-GPIO; TC1: 0; TOLERANCE: 1%; Package: 0603; MFG_NAME01: Vishay Dale; MFG_PN01: RCA060310K0FKEA; Manufacturer Part Number: RCA060310K0FKEA; Value: 10K
R11-R14 = RES_57: RES 0.0 OHM 1/16W 0402 SMD; Manufacturere's P/N: CRCW04020000Z0ED; Manufacturer: VISHAY; CLASS: DISCRETE; SIGNAL_MODEL: DEFAULT_RESISTOR_0.001OHM_2_1; AGILE_PN: 470-79965; FPLIST: RC0402_25,RC0402_HD,RC0402_X2,0402_CC; ROHS: Yes; Package: 0402; PCB Footprint: RESC1005X40N_A
R15 = R_0: as R3 on sheet PAGE03_I2C-GPIO; TC1: 0; TOLERANCE: 1%; Package: 0603; Manufacturer Part Number: RCA060310K0FKEA; Value: 10K
R30 R32 = R_0: RES SMD 47K OHM 5% 1/10W 0603; Manufacturer Part Number: AC0603JR-0747KL; Manufacturer: Yageo; TC2: 0; POWER: RMAX; MAX_TEMP: RTMAX; SLOPE: RSMAX; VOLTAGE: RVMAX; TOLERANCE: 1%; PSpiceTemplate: R^@REFDES %1 %2 ?TOLERANCE|R^@REFDES| @VALUE TC=@TC1,@TC2 ?TOLERANCE|\n.model R^@REFDES RES R=1 DEV=@TOLERANCE%|; DIST: FLAT; PCB Footprint: RESC1608X55N_A; MFG_NAME01: Vishay Dale; TC1: 0; MFG_PN01: AC0603JR-0747KL; Manufacturere's P/N: AC0603JR-0747KL; Package: 0603; Value: 47K
R34 R36 = R_0: RES SMD 47K OHM 5% 1/10W 0603; Manufacturere's P/N: AC0603JR-0747KL; Manufacturer: Yageo; TC2: 0; POWER: RMAX; MAX_TEMP: RTMAX; SLOPE: RSMAX; VOLTAGE: RVMAX; TOLERANCE: 1%; PSpiceTemplate: R^@REFDES %1 %2 ?TOLERANCE|R^@REFDES| @VALUE TC=@TC1,@TC2 ?TOLERANCE|\n.model R^@REFDES RES R=1 DEV=@TOLERANCE%|; DIST: FLAT; PCB Footprint: RESC1608X55N_A; MFG_NAME01: Vishay Dale; TC1: 0; Package: 0603; MFG_PN01: AC0603JR-0747KL; Manufacturer Part Number: AC0603JR-0747KL; Value: DNP
R35 R37 = R_0: as R1 on sheet PAGE02_CONNECTOR; TC1: 0; TOLERANCE: 1%; Package: 0603; Manufacturere's P/N: RCA060310K0FKEA; MFG_NAME01: Vishay Dale; MFG_PN01: RCA060310K0FKEA; Value: DNP
U11 = ADS1015IDGSR_1: Analog to Digital Converters - ADC 12B ADC with Int MUX; Manufacturer: TI; Package: MSOP-10; Manufacturere's P/N: ADS1015IDGSR; PCB Footprint: VSSOP50P490X110-10N
U12 = HDC2021DEBT_2: Board Mount Humidity Sensors Low-power humidity and temperature digital sensor; Manufacturer: TI; PCB Footprint: WSON100P300X300X92-7N; Manufacturere's P/N: HDC2021DEBT; Package: 6-WSON
TP10-TP17 = T POINT R: PCB Footprint: TPC160H100

## Sheet PAGE05_ISO_RELAYS.SchDoc
size 386 x 246 mm
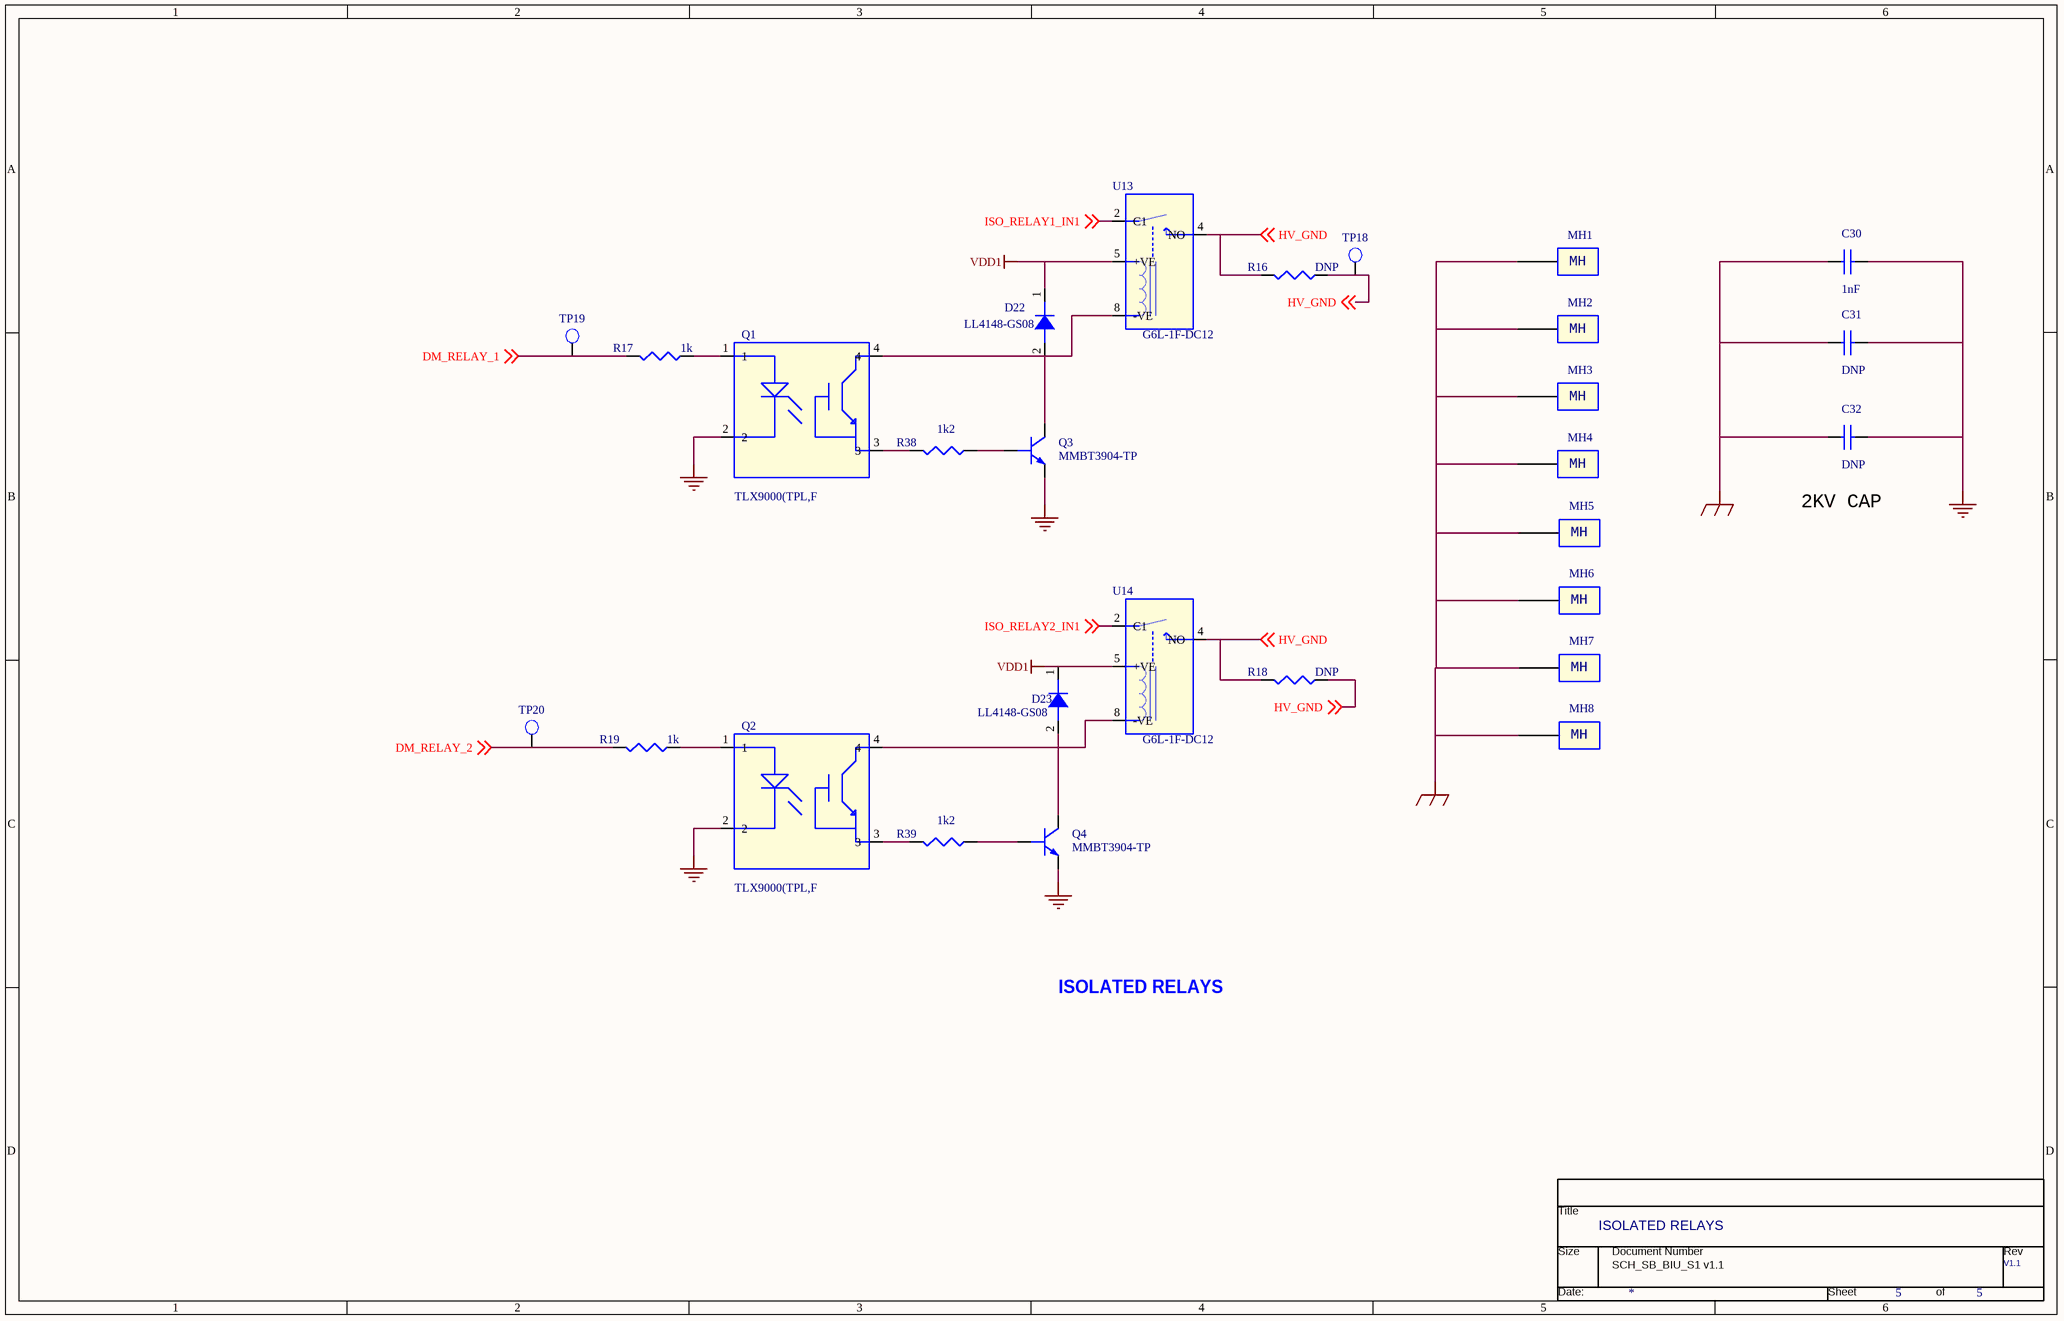
[diagram p4: PAGE05_ISO_RELAYS.SchDoc]

### Parts
(Parts that share a designator on the sheet are numbered #1, #2 ... from top to bottom, then left to right.)
*#5  Page Count: 5  Title: ISOLATED RELAYS  RevCode: V1.1  (hidden comment: TitleBlock0)  (graphical)
C30  1nF  [CAPC3216X180N_D]
C31  DNP  [CAPC3216X180N_D]
C32  DNP  [CAPC3216X180N_D]
D22  LL4148-GS08  [DIOMELF3515N]
D23  LL4148-GS08  [DIOMELF3515N]
MH1  Mounting hole  [MTG320_620]  (value not drawn)
MH2  Mounting hole  [MTG320_620]  (value not drawn)
MH3  Mounting hole  [MTG320_620]  (value not drawn)
MH4  Mounting hole  [MTG320_620]  (value not drawn)
MH5  Mounting hole  [MTG320_620]  (value not drawn)
MH6  Mounting hole  [MTG320_620]  (value not drawn)
MH7  Mounting hole  [MTG320_620]  (value not drawn)
MH8  Mounting hole  [MTG320_620]  (value not drawn)
Q1  TLX9000(TPL,F  [OPTO_TLP293_BL-TPL_E]
Q2  TLX9000(TPL,F  [OPTO_TLP293_BL-TPL_E]
Q3  MMBT3904-TP  [SOT95P237X122-3N_OSI]
Q4  MMBT3904-TP  [SOT95P237X122-3N_OSI]
R16  DNP  [RESC1608X55N_A]
R17  1k  [RESC1608X55N_A]
R18  DNP  [RESC1608X55N_A]
R19  1k  [RESC1608X55N_A]
R38  1k2  [RESC1608X55N_A]
R39  1k2  [RESC1608X55N_A]
TP18  T POINT R  [TPC160H100]  (value not drawn)
TP19  T POINT R  [TPC160H100]  (value not drawn)
TP20  T POINT R  [TPC160H100]  (value not drawn)
U13  G6L-1F-DC12  [RELAY_G6L-1F-DC12]
U14  G6L-1F-DC12  [RELAY_G6L-1F-DC12]

### Nets
CHASSIS_GND: C30.1 C31.1 C32.1 MH1.1 MH2.1 MH3.1 MH4.1 MH5.1 MH6.1 MH7.1 MH8.1
GND: C30.2 C31.2 C32.2 Q1.2 Q2.2 Q3.3(E) Q4.3(E)
VDD1: D22.1(K) D23.1(K) U13.5(+VE) U14.5(+VE)
DM_RELAY_1: R17.2 TP19.1(TP) ; off-sheet DM_RELAY_1
DM_RELAY_2: R19.2 TP20.1(TP) ; off-sheet DM_RELAY_2
HV_GND: R16.1 R16.2 R18.1 R18.2 TP18.1(TP) U13.4(NO) U14.4(NO) ; off-sheet HV_GND
ISO_RELAY1_IN1: U13.2(C1) ; off-sheet ISO_RELAY1_IN1
ISO_RELAY2_IN1: U14.2(C1) ; off-sheet ISO_RELAY2_IN1
NetD22_2: D22.2(A) Q1.4 Q3.2(C) U13.8(-VE)
NetD23_2: D23.2(A) Q2.4 Q4.2(C) U14.8(-VE)
NetQ1_1: Q1.1 R17.1
NetQ1_3: Q1.3 R38.2
NetQ2_1: Q2.1 R19.1
NetQ2_3: Q2.3 R39.2
NetQ3_1: Q3.1(B) R38.1
NetQ4_1: Q4.1(B) R39.1

### Notes on the sheet
- 2KV CAP
- ISOLATED RELAYS
- SCH_SB_BIU_S1 v1.1
- (in symbol Mounting hole) MH
- (in symbol TitleBlock0) Title; Size; Document Number; Rev; Date:; Sheet; of

### Library data of the parts
*#5 = TitleBlock0: Page Size: A; Page Number: 5; Page Create Date: March  8, 1995; Page Modify Date: *
C30-C32 = CAPACITOR NON-POL: CAP CER 1000PF 2KV X7R 1206; Manufacturere's P/N: CL31B102KJHNNNE; Manufacturer: Samsung Electro-Mechanics; Manufacturer Part Number: CL31B102KJHNNNE; Package: 1206; PCB Footprint: CAPC3216X180N_D
D22 D23 = DIODE PIN_1: as D24 on sheet PAGE03_I2C-GPIO; PCB Footprint: DIOMELF3515N; Package: SOD-80; Manufacturer Part Number: LL4148-GS08; Manufacturere's P/N: LL4148-GS08
Q1 Q2 = TLX9000TPLF_1: Transistor Output Optocouplers Transistor Coupler Automotive;; Manufacturer: Toshiba; Manufacturere's P/N: TLX9000(TPL,F; package: SO-4; PCB Footprint: OPTO_TLP293_BL-TPL_E
Q3 Q4 = NPN BCE: Manufacturer: Micro Commercial Co; PspiceTemplate: Q^@REFDES %C %B %E; Manufacturere's P/N: MMBT3904-TP; PCB Footprint: SOT95P237X122-3N_OSI
R16 R38 R39 = RES_57: Thick Film Resistors - SMD 1/10Watt 0ohms; Manufacturer Part Number: CRCW06030000Z0EAC; Manufacturer: Vishay / Dale; CLASS: DISCRETE; Package: 0603; ROHS: Yes; Manufacturere's P/N: CRCW06030000Z0EAC; PCB Footprint: RESC1608X55N_A
R17 R18 = RES_57: Thick Film Resistors - SMD 1/10Watt 0ohms; Manufacturere's P/N: CRCW06030000Z0EAC; Manufacturer: Vishay / Dale; CLASS: DISCRETE; ROHS: Yes; Package: 0603; PCB Footprint: RESC1608X55N_A
R19 = RES_57: Thick Film Resistors - SMD 1/10Watt 0ohms; Manufacturer: Vishay / Dale; Manufacturere's P/N: CRCW06030000Z0EAC; CLASS: DISCRETE; Package: 0603; ROHS: Yes; PCB Footprint: RESC1608X55N_A
U13 U14 = Relay_SPDT_b_0: as U6 on sheet PAGE03_I2C-GPIO; Manufacturere's P/N: G6L-1F-DC12; PCB Footprint: RELAY_G6L-1F-DC12
MH1-MH8 = Mounting hole: PCB Footprint: MTG320_620
TP18-TP20 = T POINT R: PCB Footprint: TPC160H100

## Nets that join several sheets
GND: PAGE02_CONNECTOR (19 pins), PAGE03_I2C-GPIO (13 pins), PAGE04_TEMP & HUMIDITY (19 pins), PAGE05_ISO_RELAYS (7 pins)
VDD1: PAGE02_CONNECTOR (5 pins), PAGE03_I2C-GPIO (9 pins), PAGE05_ISO_RELAYS (D22.1 D23.1 U13.5 U14.5)
VDD2: PAGE02_CONNECTOR (9 pins), PAGE03_I2C-GPIO (U3.3 U4.3 U4.6)
VDD3: PAGE02_CONNECTOR (C13.1 C14.1 J1.4 J1.P1), PAGE03_I2C-GPIO (12 pins), PAGE04_TEMP & HUMIDITY (12 pins)
DM_RELAY_1: PAGE02_CONNECTOR (J1.5), PAGE05_ISO_RELAYS (R17.2 TP19.1)
DM_RELAY_2: PAGE02_CONNECTOR (J1.6), PAGE05_ISO_RELAYS (R19.2 TP20.1)
HV_GND: PAGE02_CONNECTOR (L16.1), PAGE05_ISO_RELAYS (7 pins)
I2C2_SCL: PAGE02_CONNECTOR (J1.10), PAGE03_I2C-GPIO (R2.2 U2.14)
I2C2_SDA: PAGE02_CONNECTOR (J1.9), PAGE03_I2C-GPIO (R3.2 U2.15)
I2C3_SCL: PAGE02_CONNECTOR (J1.12), PAGE04_TEMP & HUMIDITY (R9.2 U11.10 U12.6)
I2C3_SDA: PAGE02_CONNECTOR (J1.11), PAGE04_TEMP & HUMIDITY (R8.2 U11.9 U12.1)
I2C_ADC_RDY: PAGE02_CONNECTOR (J1.13), PAGE04_TEMP & HUMIDITY (R10.2 U11.2)
I2C_ANI0: PAGE02_CONNECTOR (J2.15), PAGE04_TEMP & HUMIDITY (L18.1 TP10.1)
I2C_ANI1: PAGE02_CONNECTOR (J2.16), PAGE04_TEMP & HUMIDITY (L19.1 TP11.1)
I2C_ANI2: PAGE02_CONNECTOR (J2.17), PAGE04_TEMP & HUMIDITY (L20.1 TP12.1)
I2C_ANI3: PAGE02_CONNECTOR (J2.18), PAGE04_TEMP & HUMIDITY (L21.1 TP13.1)
I2C_THS_INT: PAGE02_CONNECTOR (J1.15), PAGE04_TEMP & HUMIDITY (R15.1 U12.4)
IOEXP_INT: PAGE02_CONNECTOR (J1.7), PAGE03_I2C-GPIO (R28.2 U2.13)
IOEXP_RESET: PAGE02_CONNECTOR (J1.8), PAGE03_I2C-GPIO (R29.2 U2.3)
ISO_RELAY1_IN1: PAGE02_CONNECTOR (J2.3), PAGE05_ISO_RELAYS (U13.2)
ISO_RELAY2_IN1: PAGE02_CONNECTOR (J2.4), PAGE05_ISO_RELAYS (U14.2)
RELAY1_OUT1: PAGE02_CONNECTOR (J2.9), PAGE03_I2C-GPIO (C26.2 L26.2 TP5.1)
RELAY1_OUT2: PAGE02_CONNECTOR (J2.10), PAGE03_I2C-GPIO (C27.2 L25.2 TP8.1)
RELAY2_OUT1: PAGE02_CONNECTOR (J2.11), PAGE03_I2C-GPIO (C15.2 L23.2 TP6.1)
RELAY2_OUT2: PAGE02_CONNECTOR (J2.12), PAGE03_I2C-GPIO (C16.2 L24.2 TP9.1)
RELAY3_OUT1: PAGE02_CONNECTOR (J2.8), PAGE03_I2C-GPIO (C17.2 L27.2 TP7.1)